# Altium project DAPLink GD32F103RCT6.PrjPcb
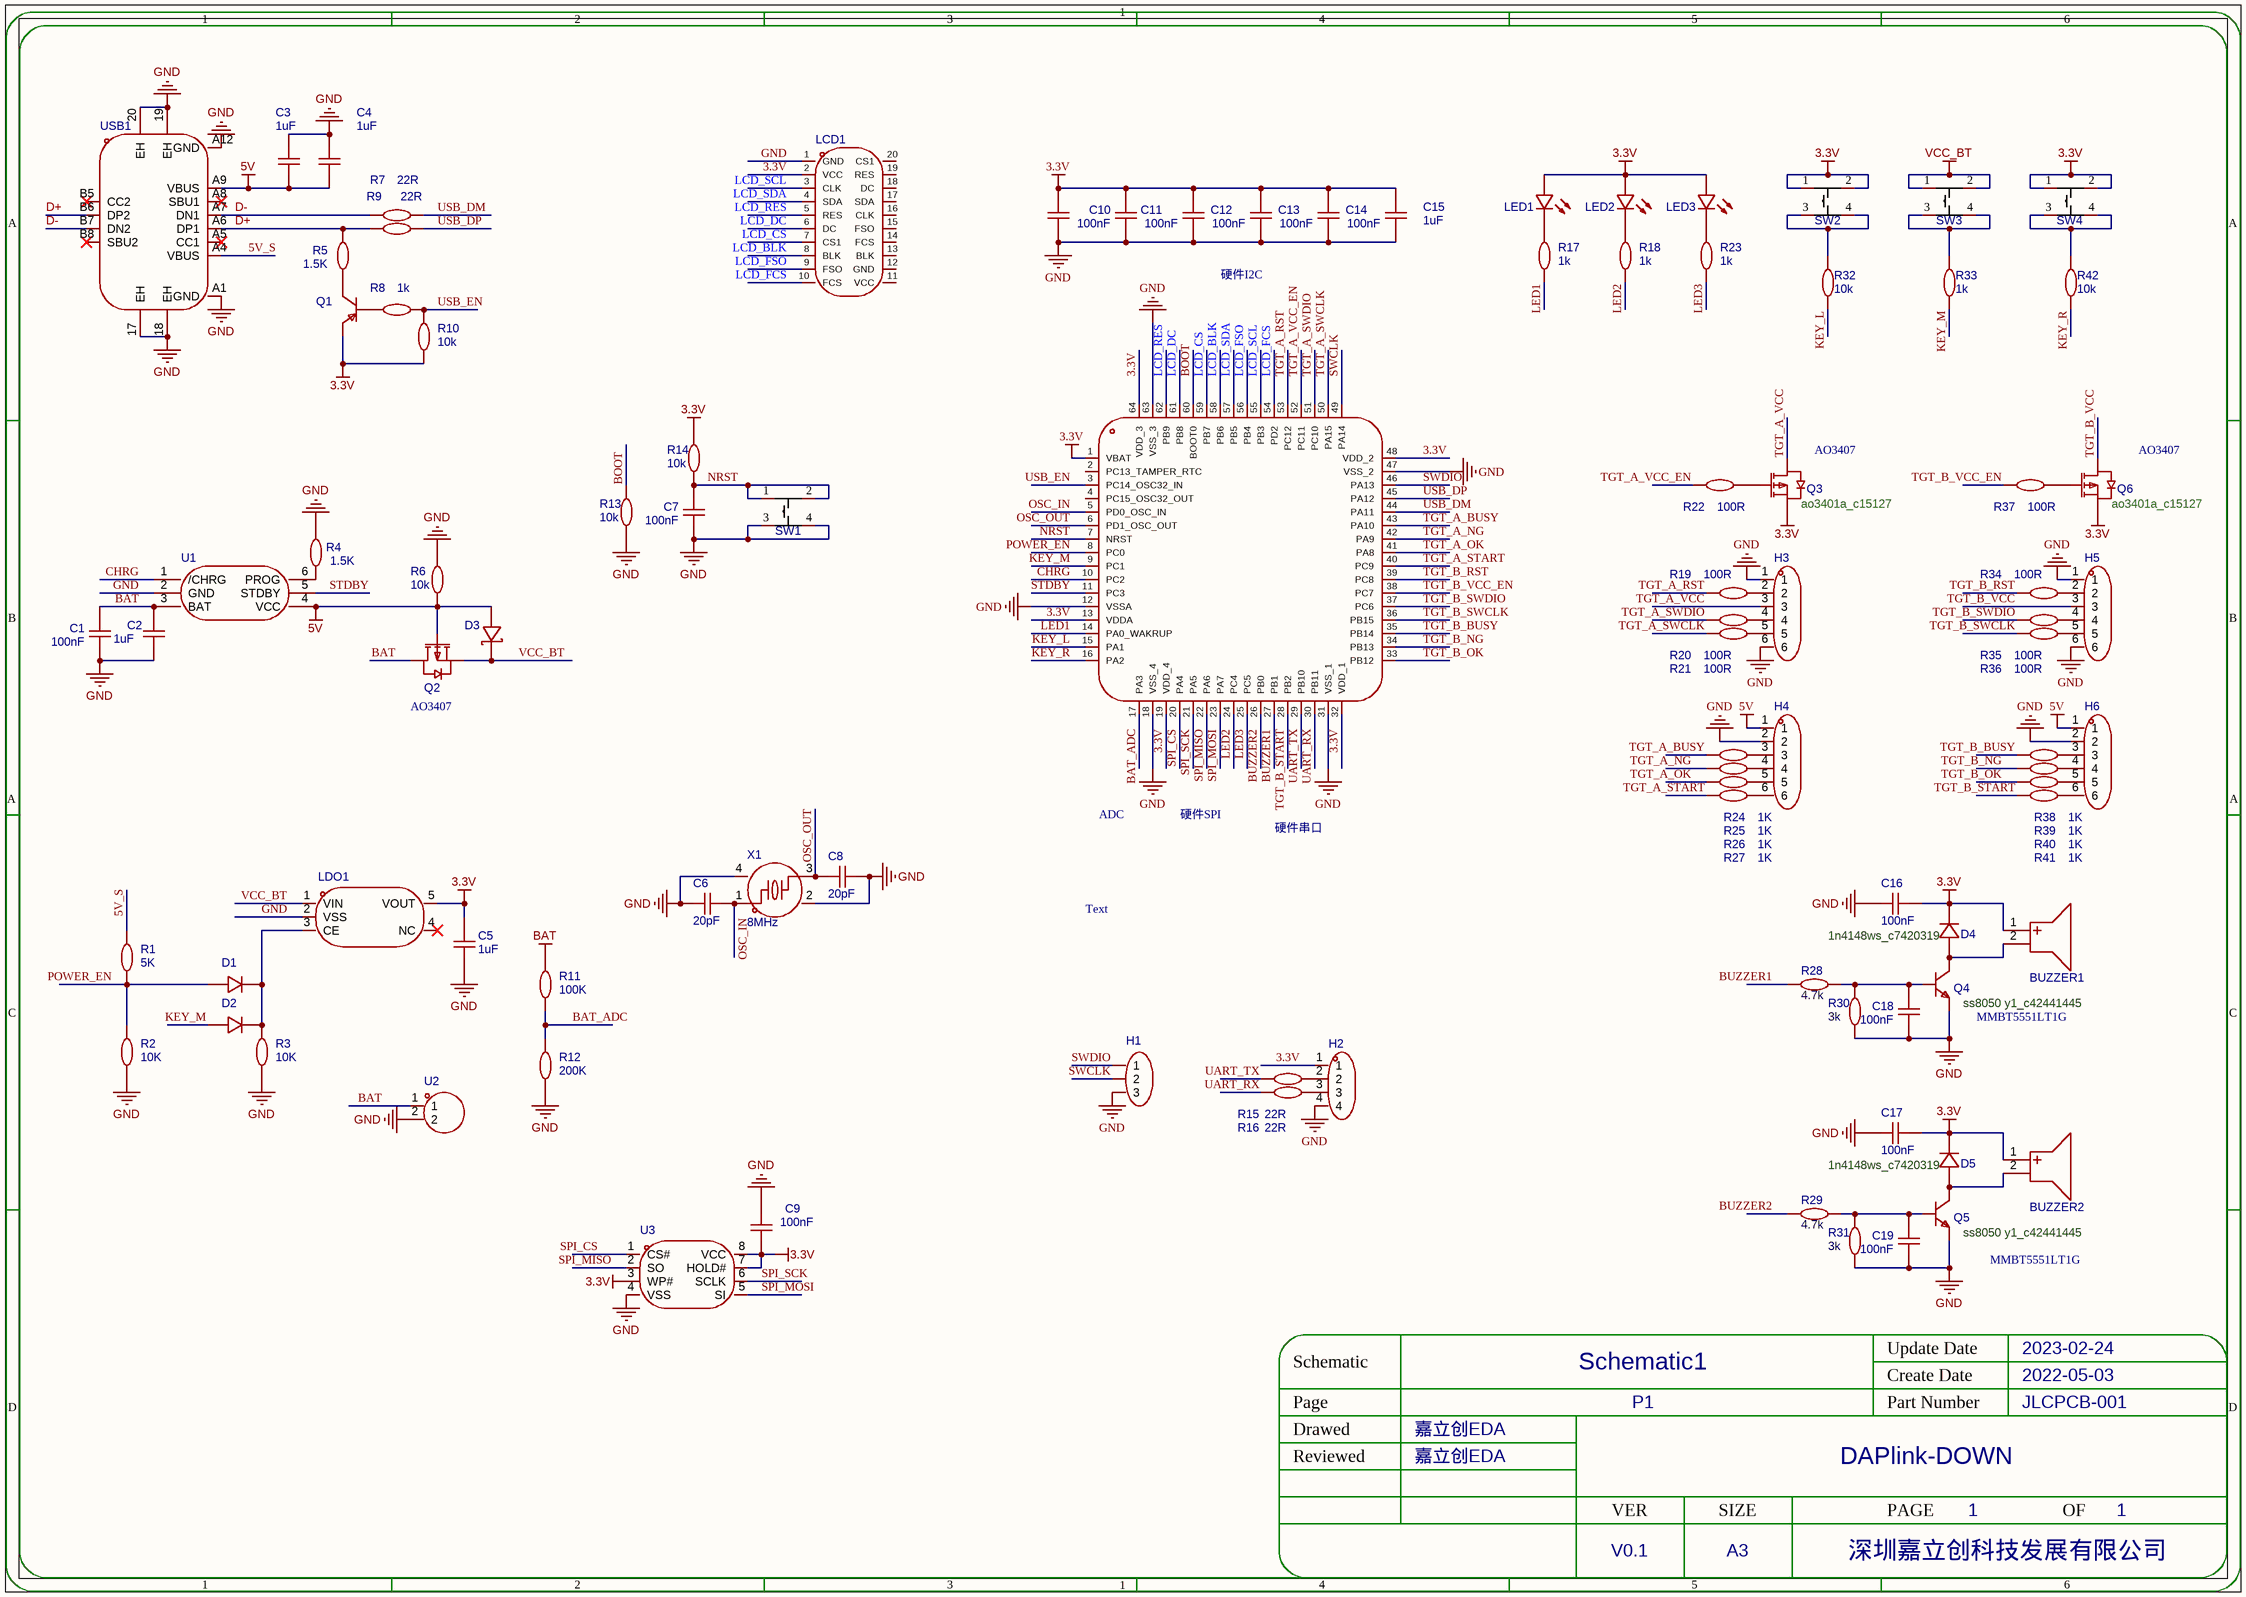
[diagram p0: DAPLink GD32F103RCT6.schdoc]
1 sheet, 95 parts. Net scope: global (net labels, ports and power ports of the same name join across sheets).
Board file: DAPLink GD32F103RCT6.PcbDoc

## Sheet DAPLink GD32F103RCT6.schdoc
size 420 x 298 mm; Symbol: Sheet-Symbol_A3; Company: 深圳嘉立创科技发展有限公司; Drawed: 嘉立创EDA; Reviewed: 嘉立创EDA; Version: V0.1; Page Size: A3; Part Number: JLCPCB-001; @Page No: 1; @Page Name: P1; Convert to PCB: yes; Add into BOM: yes; @Project Name: DAPlink-DOWN; @Page Count: 1; @Update Date: 2023-02-24; @Create Date: 2022-05-03; @Schematic Name: Schematic1; Device: Sheet-Symbol_A3; SheetNumber: 1; SheetTotal: 1

### Parts
BUZZER1  gsd9605yb-3v2800  [BUZ-SMD_GSD9605YB-3V2800]  (value not drawn)
BUZZER2  gsd9605yb-3v2800  [BUZ-SMD_GSD9605YB-3V2800]  (value not drawn)
C1  value 100nF  [C0402]
C2  value 1uF  [C0603]
C3  value 1uF  [C0805]
C4  value 1uF  [C0603]
C5  value 1uF  [C0603]
C6  value 20pF  [C0402]
C7  value 100nF  [C0603]
C8  value 20pF  [C0402]
C9  value 100nF  [C0402]
C10  value 100nF  [C0402]
C11  value 100nF  [C0402]
C12  value 100nF  [C0402]
C13  value 100nF  [C0402]
C14  value 100nF  [C0402]
C15  value 1uF  [C0603]
C16  value 100nF  [C0603]
C17  value 100nF  [C0603]
C18  value 100nF  [C0603]
C19  value 100nF  [C0603]
D1  1N4007WS  [SOD-323_L1.8-W1.3-LS2.5-RD]  (value not drawn)
D2  1N4007WS  [SOD-323_L1.8-W1.3-LS2.5-RD]  (value not drawn)
D3  (no value)  [SOD-123_L2.8-W1.8-LS3.7-RD]
D4  1n4148ws_c7420319  [SOD-323_L1.7-W1.3-LS2.5-FD]
D5  1n4148ws_c7420319  [SOD-323_L1.7-W1.3-LS2.5-FD]
H1  (no value)  [HDR-TH_3P-P2.54-V-M-1]
H2  lail-pz2.54-4p-l  [CONN-TH_LAIL-PZ2.54-4P-L]  (value not drawn)
H3  lail-pz2.54-6p-l  [CONN-TH_LAIL-PZ2.54-6P-L]  (value not drawn)
H4  lail-pz2.54-6p-l  [CONN-TH_LAIL-PZ2.54-6P-L]  (value not drawn)
H5  lail-pz2.54-6p-l  [CONN-TH_LAIL-PZ2.54-6P-L]  (value not drawn)
H6  lail-pz2.54-6p-l  [CONN-TH_LAIL-PZ2.54-6P-L]  (value not drawn)
LCD1  hs20s010b  [LCD-TH_HS20S010B]  (value not drawn)
LDO1  (no value)  [SOT-23-5_L3.0-W1.7-P0.95-LS2.8-BR]
LED1  (no value)  [LED0603-R-RD]
LED2  (no value)  [LED0603-R-RD]
LED3  (no value)  [LED0603-R-RD]
Q1  S8550  [SOT-23-3_L2.9-W1.6-P1.90-LS2.8-BR]  (value not drawn)
Q2  (no value)  [SOT-23-3_L2.9-W1.3-P1.90-LS2.4-BR]
Q3  ao3401a_c15127  [SOT-23_L2.9-W1.3-P1.90-LS2.4-BR]
Q4  ss8050 y1_c42441445  [SOT-23-3_L2.9-W1.5-P2.0-LS2.5-BR]
Q5  ss8050 y1_c42441445  [SOT-23-3_L2.9-W1.5-P2.0-LS2.5-BR]
Q6  ao3401a_c15127  [SOT-23_L2.9-W1.3-P1.90-LS2.4-BR]
R1  value 5K  [R0603]
R2  value 10K  [R0603]
R3  value 10K  [R0603]
R4  value 1.5K  [R0603]
R5  value 1.5K  [R0603]
R6  value 10k  [R0603]
R7  value 22R  [R0402]
R8  value 1k  [R0603]
R9  value 22R  [R0402]
R10  value 10k  [R0603]
R11  value 100K  [R0603]
R12  value 200K  [R0603]
R13  value 10k  [R0603]
R14  value 10k  [R0603]
R15  value 22R  [R0603]
R16  value 22R  [R0603]
R17  value 1k  [R0603]
R18  value 1k  [R0603]
R19  value 100R  [R0603]
R20  value 100R  [R0603]
R21  value 100R  [R0603]
R22  value 100R  [R0603]
R23  value 1k  [R0603]
R24  value 1K  [R0603]
R25  value 1K  [R0603]
R26  value 1K  [R0603]
R27  value 1K  [R0603]
R28  4.7k  [R0603]
R29  4.7k  [R0603]
R30  3k  [R0603]
R31  3k  [R0603]
R32  value 10k  [R0603]
R33  value 1k  [R0603]
R34  value 100R  [R0603]
R35  value 100R  [R0603]
R36  value 100R  [R0603]
R37  value 100R  [R0603]
R38  value 1K  [R0603]
R39  value 1K  [R0603]
R40  value 1K  [R0603]
R41  value 1K  [R0603]
R42  value 10k  [R0603]
SW1  TS-1002S-07526C  [DOT6X6SMT]  (value not drawn)
SW2  TS-1002S-07526C  [DOT6X6SMT]  (value not drawn)
SW3  TS-1002S-07526C  [DOT6X6SMT]  (value not drawn)
SW4  TS-1002S-07526C  [DOT6X6SMT]  (value not drawn)
U1  TP4059  [SOT-23-6_L2.9-W1.6-P0.95-LS2.8-BR]  (value not drawn)
U2  (no value)  [CONN-TH_T2B-SQ-LF-SN]
U3  (no value)  [SOP-8_L5.3-W5.2-P1.27-LS7.9-BL]
U4  gd32f103rct6  [LQFP-64_L10.0-W10.0-P0.50-LS12.0-BL]  (value not drawn)
USB1  (no value)  [USB-C-SMD_TYPE-C-16P-QTGM027]
X1  value 8MHz  [OSC-SMD_4P-L3.2-W2.5-BL]

### Nets
3.3V: BUZZER1.1(+) BUZZER2.1(+) C5.2 C9.1 C10.2 C11.2 C12.2 C13.2 C14.2 C15.2 C16.1 C17.1 D4.2(K) D5.2(K) H2.1 LCD1.2(VCC) LDO1.5(VOUT) LED1.1(A) LED2.1(A) LED3.1(A) Q1.2 Q3.2(S) Q6.2(S) R10.1 R14.2 SW2.1 SW2.2 SW4.1 SW4.2 U3.3(WP#) U3.7(HOLD#) U3.8(VCC) U4.1(VBAT) U4.13(VDDA) U4.19(VDD_4) U4.32(VDD_1) U4.48(VDD_2) U4.64(VDD_3)
5V: C3.1 C4.1 D3.2(A) H4.1 H6.1 Q2.1(G) R6.1 U1.4(VCC) USB1.A9(VBUS)
BAT: C1.2 C2.2 Q2.3(D) R11.2 U1.3(BAT) U2.1
GND: C1.1 C2.1 C3.2 C4.2 C5.1 C6.1 C7.1 C8.2 C9.2 C10.1 C11.1 C12.1 C13.1 C14.1 C15.1 C16.2 C17.2 C18.1 C19.1 H1.3 H2.4 H3.1 H3.6 H4.2 H5.1 H5.6 H6.2 LCD1.1(GND) LDO1.2(VSS) Q4.2(E) Q5.2(E) R2.1 R3.1 R4.1 R6.2 R12.1 R13.1 R30.1 R31.1 SW1.3 SW1.4 U1.2(GND) U2.2 U3.4(VSS) U4.12(VSSA) U4.18(VSS_4) U4.31(VSS_1) U4.47(VSS_2) U4.63(VSS_3) USB1.17(EH) USB1.18(EH) USB1.19(EH) USB1.20(EH) USB1.A1(GND) USB1.A12(GND) X1.2(GND) X1.4(GND)
VCC_BT: D3.1(K) LDO1.1(VIN) Q2.2(S) SW3.1 SW3.2
5V_S: R1.2 USB1.A4(VBUS)
BAT_ADC: R11.1 R12.2 U4.17(PA3)
BOOT: R13.2 U4.60(BOOT0)
BUZZER1: R28.1 U4.27(PB1)
BUZZER2: R29.1 U4.26(PB0)
CHRG: U1.1(/CHRG) U4.10(PC2)
D+: R5.1 R9.2 USB1.A6(DP1) USB1.B6(DP2)
D-: R7.1 USB1.A7(DN1) USB1.B7(DN2)
KEY_L: R32.1 U4.15(PA1)
KEY_M: D2.2(A) R33.1 U4.9(PC1)
KEY_R: R42.1 U4.16(PA2)
LCD_BLK: LCD1.8(BLK) U4.58(PB6)
LCD_CS: LCD1.7(CS1) U4.59(PB7)
LCD_DC: LCD1.6(DC) U4.61(PB8)
LCD_FCS: LCD1.10(FCS) U4.54(PD2)
LCD_FSO: LCD1.9(FSO) U4.56(PB4)
LCD_RES: LCD1.5(RES) U4.62(PB9)
LCD_SCL: LCD1.3(CLK) U4.55(PB3)
LCD_SDA: LCD1.4(SDA) U4.57(PB5)
LED1: R17.1 U4.14(PA0_WAKRUP)
LED2: R18.1 U4.24(PC4)
LED3: R23.1 U4.25(PC5)
NRST: C7.2 R14.1 SW1.1 SW1.2 U4.7(NRST)
OSC_IN: C6.2 U4.5(PD0_OSC_IN) X1.1
OSC_OUT: C8.1 U4.6(PD1_OSC_OUT) X1.3
POWER_EN: D1.2(A) R1.1 R2.2 U4.8(PC0)
SPI_CS: U3.1(CS#) U4.20(PA4)
SPI_MISO: U3.2(SO) U4.22(PA6)
SPI_MOSI: U3.5(SI) U4.23(PA7)
SPI_SCK: U3.6(SCLK) U4.21(PA5)
STDBY: U1.5(STDBY) U4.11(PC3)
SWCLK: H1.2 U4.49(PA14)
SWDIO: H1.1 U4.46(PA13)
TGT_A_BUSY: R24.2 U4.43(PA10)
TGT_A_NG: R25.2 U4.42(PA9)
TGT_A_OK: R26.2 U4.41(PA8)
TGT_A_RST: R19.2 U4.53(PC12)
TGT_A_START: R27.2 U4.40(PC9)
TGT_A_SWCLK: R21.2 U4.50(PA15)
TGT_A_SWDIO: R20.2 U4.51(PC10)
TGT_A_VCC: H3.3 Q3.3(D)
TGT_A_VCC_EN: R22.2 U4.52(PC11)
TGT_B_BUSY: R38.2 U4.35(PB14)
TGT_B_NG: R39.2 U4.34(PB13)
TGT_B_OK: R40.2 U4.33(PB12)
TGT_B_RST: R34.2 U4.39(PC8)
TGT_B_START: R41.2 U4.28(PB2)
TGT_B_SWCLK: R36.2 U4.36(PB15)
TGT_B_SWDIO: R35.2 U4.37(PC6)
TGT_B_VCC: H5.3 Q6.3(D)
TGT_B_VCC_EN: R37.2 U4.38(PC7)
UART_RX: R16.2 U4.30(PB11)
UART_TX: R15.2 U4.29(PB10)
USB_DM: R7.2 U4.44(PA11)
USB_DP: R9.1 U4.45(PA12)
USB_EN: R8.1 R10.2 U4.3(PC14_OSC32_IN)
NetBUZZER1_2: BUZZER1.2(-) D4.1(A) Q4.3(C)
NetBUZZER2_2: BUZZER2.2(-) D5.1(A) Q5.3(C)
NetC18_2: C18.2 Q4.1(B) R28.2 R30.2
NetC19_2: C19.2 Q5.1(B) R29.2 R31.2
NetD1_1: D1.1(K) D2.1(K) LDO1.3(CE) R3.2
NetH2_2: H2.2 R15.1
NetH2_3: H2.3 R16.1
NetH3_2: H3.2 R19.1
NetH3_4: H3.4 R20.1
NetH3_5: H3.5 R21.1
NetH4_3: H4.3 R24.1
NetH4_4: H4.4 R25.1
NetH4_5: H4.5 R26.1
NetH4_6: H4.6 R27.1
NetH5_2: H5.2 R34.1
NetH5_4: H5.4 R35.1
NetH5_5: H5.5 R36.1
NetH6_3: H6.3 R38.1
NetH6_4: H6.4 R39.1
NetH6_5: H6.5 R40.1
NetH6_6: H6.6 R41.1
NetLED1_2: LED1.2(K) R17.2
NetLED2_2: LED2.2(K) R18.2
NetLED3_2: LED3.2(K) R23.2
NetQ1_1: Q1.1 R8.2
NetQ1_3: Q1.3 R5.2
NetQ3_1: Q3.1(G) R22.1
NetQ6_1: Q6.1(G) R37.1
NetR4_2: R4.2 U1.6(PROG)
NetR32_2: R32.2 SW2.3 SW2.4
NetR33_2: R33.2 SW3.3 SW3.4
NetR42_2: R42.2 SW4.3 SW4.4

Not connected (* = marked no-connect by the designer): LCD1 11(VCC) 12(GND) 13(BLK) 14(FCS) 15(FSO) 16(CLK) 17(SDA) 18(DC) 19(RES) 20(CS1); LDO1 4(NC)*; U4 2(PC13_TAMPER_RTC) 4(PC15_OSC32_OUT); USB1 A5(CC1)* A8(SBU1)* B5(CC2)* B8(SBU2)*

### Notes on the sheet
- 硬件I2C
- (near Q3) AO3407
- (near Q6) AO3407
- (near Q2) AO3407
- ADC
- 硬件SPI
- 硬件串口
- Text
- (near Q4) MMBT5551LT1G
- (near Q5) MMBT5551LT1G
- 1
- 2
- 3
- 4
- 5
- 6
- A
- B
- C
- Update Date
- 2023-02-24
- D
- Schematic
- Page
- P1
- Schematic1
- Create Date
- Part Number
- JLCPCB-001
- 2022-05-03
- Reviewed
- Drawed
- 嘉立创EDA
- DAPlink-DOWN
- VER
- V0.1
- SIZE
- A3
- PAGE
- 深圳嘉立创科技发展有限公司
- OF

### Library data of the parts
BUZZER1 BUZZER2 = gsd9605yb-3v2800: 驱动方式:有源(内含驱动线路);构造类型:电磁式;额定电压:3.3V;频率:2.7kHz;声压(SPL):80dB;; Manufacturer: INGHAi(赢海); AddInBom: yes; ModelId: d9f071f9511e4f7795b1f85db8085480; ModelName: BUZ-SMD_L9.6-W9.6-H5.0; ModelTransform: 393.7,377.952,0,270,0,0,0,0,0; Voltage Rating: 3.3V; Voltage - Supply: 2V~5V; Value: 2.7kHz; Current Consumption: 30mA; Sound Pressure Level(SPL): 80dB; Symbol: GSD9605YB-3V2800; LCSC Part Name: 9.6*9.6*5mm电磁有源 3V; SupplierPart: C255327; ManufacturerPart: GSD9605YB-3V2800; Supplier Footprint: SMD,9.6x9.6mm; JLCPCB Part Class: Extended Part; Datasheet: https://item.szlcsc.com/datasheet/GSD9605YB-3V2800/249279.html; Supplier: LCSC; ConvertToPcb: yes; FootprintName: BUZ-SMD_GSD9605YB-3V2800; Driver Circuitry: 有源(内含驱动线路); Technology: 电磁式; Diameter(φD): -; Length: 9.6mm; Width: 9.6mm; Height: 5.2mm; Operating Temperature: -20℃~+70℃; Mounting Type: 贴片; Lead Pitch: -; Continuous Operating Time: -
C1 C7 C9-C14 C16-C19 = CC0402CRNPO9BN100: 容值:10pF;精度:±0.25pF;额定电压:50V;温度系数:NP0;; Manufacturer: YAGEO(国巨); AddInBom: yes; ModelId: 36a51122f27c49738f86b3bfa98863e0; ModelName: C0402_L1.0-W0.5-H0.5; ModelTransform: 39.37,19.685,0,0,0,0,0,0,0; Tolerance: ±0.25pF; Voltage Rated: 50V; Temperature Coefficient: NP0; Device: CC0402CRNPO9BN100; Symbol: CC0402CRNPO9BN100; LCSC Part Name: 10pF ±0.25pF 50V; SupplierPart: C526974; ManufacturerPart: CC0402CRNPO9BN100; Supplier Footprint: 0402; JLCPCB Part Class: Extended Part; Datasheet: https://atta.szlcsc.com/upload/public/pdf/source/20200508/C526974_3517A3A30DC68049E27EE400BC6F4C82.pdf; Supplier: LCSC; ConvertToPcb: yes; FootprintName: C0402
C2 C4 C5 C15 = C0603C102K1RAC3083: 容值:1nF;精度:±10%;额定电压:100V;温度系数:X7R;; Manufacturer: KEMET(基美); AddInBom: yes; ModelId: ac125912035d415993ca9572d50418b1; ModelName: C0603_L1.6-W0.8-H0.8; ModelTransform: 62.992,31.496,0,0,0,0,0,0,0; Tolerance: ±10%; Voltage Rated: 100V; Temperature Coefficient: X7R; Device: C0603C102K1RAC3083; Symbol: C0603C102K1RAC3083; LCSC Part Name: 1nF ±10% 100V; SupplierPart: C561818; ManufacturerPart: C0603C102K1RAC3083; Supplier Footprint: 0603; JLCPCB Part Class: Extended Part; Datasheet: https://atta.szlcsc.com/upload/public/pdf/source/20200618/C599608_2B9CFB7169FD5127D28BF69D59417288.pdf; Supplier: LCSC; ConvertToPcb: yes; FootprintName: C0603
C3 = CS0805KKX7R8BB105: 容值:1uF;精度:±10%;额定电压:25V;温度系数:X7R;; Manufacturer: YAGEO(国巨); AddInBom: yes; ModelId: 1ba041120af144c991958decab20d241; ModelName: C0805_L2.0-W1.3-H1.3; ModelTransform: 78.74,51.181,0,0,0,0,0,0.0005,0; Tolerance: ±10%; Voltage Rated: 25V; Temperature Coefficient: X7R; Device: CS0805KKX7R8BB105; Symbol: CS0805KKX7R8BB105; LCSC Part Name: 1uF ±10% 25V; SupplierPart: C272869; ManufacturerPart: CS0805KKX7R8BB105; Supplier Footprint: 0805; JLCPCB Part Class: Extended Part; Datasheet: https://atta.szlcsc.com/upload/public/pdf/source/20180820/C272869_BA73BCEFB473D3E1AF31EC64F07F73BB.pdf; Supplier: LCSC; ConvertToPcb: yes; FootprintName: C0805
C6 C8 = GCM1555C1H200JA16D: 容值:20pF;精度:±5%;额定电压:-;温度系数:-;; Manufacturer: muRata(村田); AddInBom: yes; ModelId: 36a51122f27c49738f86b3bfa98863e0; ModelName: C0402_L1.0-W0.5-H0.5; ModelTransform: 39.37,19.685,0,0,0,0,0,0,0; Tolerance: ±5%; Device: GCM1555C1H200JA16D; Symbol: GCM1555C1H200JA16D; LCSC Part Name: 20pF(200) ±5% 50V; SupplierPart: C343868; ManufacturerPart: GCM1555C1H200JA16D; Supplier Footprint: 0402; JLCPCB Part Class: Extended Part; Datasheet: https://atta.szlcsc.com/upload/public/pdf/source/20200713/C701256_2542DCDD70722D2BE0CCE4799A0421BC.pdf; Supplier: LCSC; ConvertToPcb: yes; FootprintName: C0402; Voltage Rated: -; Temperature Coefficient: -
D1 D2 = 1N4007WS: 1000V,1A,VF=1.1V@1A，M7小封装; Manufacturer: MDD; AddInBom: yes; ModelId: e9dd044ee7bf4221b3b795eb56bce7c0; ModelName: SOD-323_L1.7-W1.3-H1.1-LS2.5; ModelTransform: 98.91933,51.181,0,180,0,0,0.985,-0.0005,0; Device: 1N4007WS; Symbol: 1N4007WS; LCSC Part Name: 1N4007WS; SupplierPart: C193404; ManufacturerPart: 1N4007WS; Supplier Footprint: SOD-323; JLCPCB Part Class: 扩展库; Datasheet: https://atta.szlcsc.com/upload/public/pdf/source/20180525/C193404_0C623596A90FA1D1FBDCFE625FBC3C97.pdf; Supplier: LCSC; ConvertToPcb: yes; FootprintName: SOD-323_L1.8-W1.3-LS2.5-RD
D3 = DSK24 K24: 直流反向耐压(Vr):40V;平均整流电流(Io):2A;正向压降(Vf):550mV@2A;; Manufacturer: MDD; AddInBom: yes; ModelId: 7884390a25fb4c08947731ebfba7e3f8; ModelTransform: 144.9,63,0,0,0,0,0,0,0; Reverse Voltage (Vr): 40V; Average Rectified Current (Io): 2A; Device: DSK24 K24; Symbol: DSK24 K24; LCSC Part Name: 40V 2A 550mV@2A; SupplierPart: C64890; ManufacturerPart: DSK24 K24; Supplier Footprint: SOD-123FL; JLCPCB Part Class: Extended Part; Datasheet: https://atta.szlcsc.com/upload/public/pdf/source/20190305/C64890_FF2133F90E969198891C9074DED26AB5.pdf; Supplier: LCSC; ConvertToPcb: yes; FootprintName: SOD-123_L2.8-W1.8-LS3.7-RD; ModelName: SOD-123_L2.8-W1.8-LS3.7-RD; Forward Voltage (Vf@If): 550mV@2A
D4 D5 = 1n4148ws_c7420319: 二极管配置:独立式;整流电流:150mA;直流反向耐压(Vr):100V;正向压降(Vf):1.25V@150mA;反向恢复时间(Trr):4ns;; Manufacturer: R+O(宏嘉诚); AddInBom: yes; ModelId: 0f2f330c645944df9245ac3c3fec3456; ModelTransform: 98.425,49.2125,0,180,0,0,0,0,0; Diode Configuration: 独立式; Pd - Power Dissipation: 200mW; Current - Rectified: 150mA; Voltage - DC Reverse(Vr): 100V; Non-Repetitive Peak Forward Surge Current: 2A; Reverse Leakage Current (Ir): 1uA@75V; Reverse Recovery Time (trr): 4ns; Operating Junction Temperature Range: -55℃~+150℃; Symbol: 1N4148WS_C7420319; LCSC Part Name: 100V 150mA; SupplierPart: C7420319; ManufacturerPart: 1N4148WS; Supplier Footprint: SOD-323; JLCPCB Part Class: Extended Part; Datasheet: https://item.szlcsc.com/datasheet/1N4148WS/8397141.html; Supplier: LCSC; ConvertToPcb: yes; FootprintName: SOD-323_L1.7-W1.3-LS2.5-FD; ModelName: SOD-323_L1.7-W1.3-LS2.5-FD; Voltage - Forward(Vf@If): 1.25V@150mA
H1 = 2.54-1*3P针: 间距:2.54mm;总PIN位数:3;排数:1;插针结构:-;行距:-;安装类型:直插;圆针/方针:-;额定电流:-;额定电压:-;配合针长度:-;塑高:-;触头材质:-;触头镀层:-;颜色:黑色;; Manufacturer: BOOMELE(博穆精密); Symbol: Header-Male-2.54_1x3; AddInBom: yes; ModelId: 94a8ffe137b6410295cb18cd3ffd99db; ModelName: HDR-M-2.54_1x3; ModelTransform: 300,100,0,0,0,0,0,0,-118.1; Pitch: 2.54mm; Device: 2.54-1*3P针; LCSC Part Name: 2.54mm; SupplierPart: C49257; ManufacturerPart: 2.54-1*3P针; Supplier Footprint: 插件; JLCPCB Part Class: Extended Part; Datasheet: https://atta.szlcsc.com/upload/public/pdf/source/20151109/1457707570948.pdf; Supplier: LCSC; ConvertToPcb: yes; FootprintName: HDR-TH_3P-P2.54-V-M-1; Number of Pins: 3; Number of Rows: 1; Pin Structure: -; Row Spacing: -; Mounting Type: 直插; Circluar Pins/Square Pins: -; Current Rating (Max): -; Voltage Rating (Max): -; Length of Mating Pin: -; Insulation Height: -; Contact Material: -; Contact Plating: -; Color: 黑色
H2 = lail-pz2.54-4p-l: 插针结构:1x4P;间距:2.54mm;圆针/方针:方针;安装方式:直插;排数:单排;总PIN位数:4P;额定电流:3A;额定电压:250V;配合针长度:6mm;塑高:2.5mm;端接针长度:3mm;触头材质:黄铜;触头镀层:金;工作温度:-25℃~+80℃;颜色:黑色;; Manufacturer: LAILAN(莱联); AddInBom: yes; ModelId: 112b012cb4004446aa5386c9c86d05f0; ModelTransform: 400.039,100,0,0,0,0,0,0,-118.11; Pin Structure: 1x4P; Pitch: 2.54mm; Circluar Pins/Square Pins: 方针; Current Rating: 3A; Voltage Rating (Max): 250V; LCSC Part Name: 1x4P 间距:2.54mm 方针 直插; SupplierPart: C54950602; ManufacturerPart: LAIL-PZ2.54-4P-L; Supplier Footprint: 插件,P=2.54mm; JLCPCB Part Class: Extended Part; Datasheet: https://item.szlcsc.com/datasheet/LAIL-PZ2.54-4P-L/58519955.html; Supplier: LCSC; ConvertToPcb: yes; SymbolName: LAIL-PZ2.54-4P-L; FootprintName: CONN-TH_LAIL-PZ2.54-4P-L; ModelName: CONN-TH_LAIL-PZ2.54-4P-L; Mounting Type: 直插; Number of Rows: 单排; Number of Pins: 4P; Length of Mating Pin: 6mm; Insulation Height: 2.5mm; Length of End Connection Pin: 3mm; Contact Material: 黄铜; Contact Plating: 金; Operating Temperature: -25℃~+80℃; Color: 黑色
H3-H6 = lail-pz2.54-6p-l: 插针结构:1x6P;间距:2.54mm;圆针/方针:方针;安装方式:直插;排数:单排;总PIN位数:6P;额定电流:3A;额定电压:250V;配合针长度:6mm;塑高:2.5mm;端接针长度:3mm;触头材质:黄铜;触头镀层:金;工作温度:-25℃~+80℃;颜色:黑色;; Manufacturer: LAILAN(莱联); AddInBom: yes; ModelId: 78d66b34ad7c4f8faa1ccf54151694d8; ModelTransform: 599.999,98.8187,0,0,0,0,0,0,-118.11; Pin Structure: 1x6P; Pitch: 2.54mm; Circluar Pins/Square Pins: 方针; Current Rating: 3A; Voltage Rating (Max): 250V; LCSC Part Name: 1x6P 间距:2.54mm 方针 直插; SupplierPart: C54950607; ManufacturerPart: LAIL-PZ2.54-6P-L; Supplier Footprint: 插件,P=2.54mm; JLCPCB Part Class: Extended Part; Datasheet: https://item.szlcsc.com/datasheet/LAIL-PZ2.54-6P-L/58519960.html; Supplier: LCSC; ConvertToPcb: yes; SymbolName: LAIL-PZ2.54-6P-L; FootprintName: CONN-TH_LAIL-PZ2.54-6P-L; ModelName: CONN-TH_LAIL-PZ2.54-6P-L; Mounting Type: 直插; Number of Rows: 单排; Number of Pins: 6P; Length of Mating Pin: 6mm; Insulation Height: 2.5mm; Length of End Connection Pin: 3mm; Contact Material: 黄铜; Contact Plating: 金; Operating Temperature: -25℃~+80℃; Color: 黑色
LCD1 = hs20s010b: 核心芯片:ST7789;尺寸(inch):2;像素分辨率:320x240;; Manufacturer: HS(汉昇); AddInBom: yes; ModelId: 0121547e629f428887221e14eec3ec9e; ModelTransform: 1425.194,2488.18384,0,0,0,0,0,0,0; Controller Type: ST7789; Symbol: HS20S010B; LCSC Part Name: 2.0寸240*320(RGB)彩色SPI串口TFT液晶显示屏; SupplierPart: C5329586; ManufacturerPart: HS20S010B; Supplier Footprint: -; JLCPCB Part Class: Extended Part; Datasheet: https://item.szlcsc.com/datasheet/HS20S010B/6087847.html; Supplier: LCSC; ConvertToPcb: yes; FootprintName: LCD-TH_HS20S010B; ModelName: LCD-TH_HS20S010B; Size: 2; Dot Pixels: 320x240; Operating Temperature: -20℃~+70℃
LDO1 = ME6211C33M5G-N: 输出类型:固定;输出极性:正;输出通道数:1;最大输入电压:6V;输出电压:3.3V;压差:260mV@(200mA);输出电流:500mA;电源纹波抑制比(PRSS):70dB@(1kHz),62dB@(10kHz);; Manufacturer: MICRONE(南京微盟); AddInBom: yes; ModelId: 0a2a1b8f50944f73965918ad6e5fe167; ModelName: SOT-23-5_L2.9-W1.6-H1.1-LS2.8-P0.95; ModelTransform: 114.2,109.6,0,180,0,0,-0.9,0.9,0; Output Type: 固定; Output Polarity: 正; Number of Outputs: 1; Maximum Input Voltage: 6V; Output Voltage: 3.3V; Output Current: 500mA; Device: ME6211C33M5G-N; Symbol: ME6211C33M5G-N; LCSC Part Name: Vin=6V Vout=3.3V 500mA 70dB@(1kHz),62dB@(10kHz); SupplierPart: C82942; ManufacturerPart: ME6211C33M5G-N; Supplier Footprint: SOT-23-5; JLCPCB Part Class: Extended Part; Datasheet: https://atta.szlcsc.com/upload/public/pdf/source/20170918/C82942_1505727073070976520.pdf; Supplier: LCSC; ConvertToPcb: yes; FootprintName: SOT-23-5_L3.0-W1.7-P0.95-LS2.8-BR; Dropout Voltage: 260mV@(200mA); Power Supply Rejection Ratio (PRSS): 70dB@(1kHz),62dB@(10kHz)
LED1-LED3 = NCD0603B4: 发光颜色:蓝灯;; Manufacturer: 国星光电; Symbol: FC-F1608BK-470H5; AddInBom: yes; ModelId: eca76de2c48042b48052f5876bb6c831; ModelTransform: 63.7794,31.496,0,0,0,0,0,0,0; Emitted Color: 蓝灯; Device: NCD0603B4; LCSC Part Name: 蓝灯; SupplierPart: C89814; ManufacturerPart: NCD0603B4; Supplier Footprint: 0603; JLCPCB Part Class: Extended Part; Datasheet: https://atta.szlcsc.com/upload/public/pdf/source/20200820/C89814_3D11357C976AB31B19046E836063F91D.pdf; Supplier: LCSC; ConvertToPcb: yes; FootprintName: LED0603-R-RD; ModelName: LED0603-R-RD
Q1 = S8550_C105432: 晶体管类型:PNP;集射极击穿电压(Vceo):25V;集电极电流(Ic):500mA;功率(Pd):300mW;集电极截止电流(Icbo):100nA;集电极-发射极饱和电压(VCE(sat)@Ic,Ib):600mV@500mA,50mA;直流电流增益(hFE@Ic,Vce):120@50mA,1V;特征频率(fT):150MHz;工作温度:+150℃@(Tj);; Manufacturer: CJ(江苏长电/长晶); AddInBom: yes; ModelId: 89cb27a44ab2466697082bb9fd73a7d0; ModelName: SOT-23-3L_L2.9-W1.6-H1.1-LS2.8-P0.95; ModelTransform: 110.236,114.173,0,180,0,0,-0.005,0.0005,0; Transistor Type: PNP; Collector-Emitter Breakdown Voltage (Vceo): 25V; Collector Current (Ic): 500mA; Power Dissipation (Pd): 300mW; Collector Cut-Off Current (Icbo): 100nA; Transition Frequency (fT): 150MHz; Device: S8550_C105432; Symbol: S8550_C105432; LCSC Part Name: PNP 25V 500mA L档120-200; SupplierPart: C105432; ManufacturerPart: S8550; Supplier Footprint: SOT-23-3L; JLCPCB Part Class: 基础库; Datasheet: https://atta.szlcsc.com/upload/public/pdf/source/20170413/1492062713649.pdf; Supplier: LCSC; ConvertToPcb: yes; FootprintName: SOT-23-3_L2.9-W1.6-P1.90-LS2.8-BR; Collector-Emitter Saturation Voltage (VCE(sat)@Ic,Ib): 600mV@500mA,50mA; DC Current Gain (hFE@Ic,Vce): 120@50mA,1V; Operating Temperature: +150℃@(Tj)
Q2 = AO3423: 类型:P沟道;漏源电压(Vdss):20V;连续漏极电流(Id):4.5A;功率(Pd):1.25W;导通电阻(RDS(on)@Vgs,Id):35mΩ@10V,5.1A;阈值电压(Vgs(th)@Id):1.5V@250A;; Manufacturer: VBsemi(台湾微碧); Symbol: AO3423_C692958; AddInBom: yes; ModelId: c62791f0466c4ae2a892c056b845b0ca; ModelName: SOT-23-3P_L2.9-W1.3-H1.0-LS2.4-P0.95; ModelTransform: 98.425,114.173,0,180,0,0,0.0005,-0.0005,0; Type: P沟道; Drain Source Voltage (Vdss): 20V; Continuous Drain Current (Id): 4.5A; Power Dissipation (Pd): 1.25W; Gate Threshold Voltage (Vgs(th)@Id): 1.5V@250A; Device: AO3423; LCSC Part Name: P沟道 20V 4.5A; SupplierPart: C692958; ManufacturerPart: AO3423; Supplier Footprint: SOT-23-3; JLCPCB Part Class: Extended Part; Datasheet: https://atta.szlcsc.com/upload/public/pdf/source/20200629/C692958_8E3397F4108F33A40C5B9FD9962FA608.pdf; Supplier: LCSC; ConvertToPcb: yes; FootprintName: SOT-23-3_L2.9-W1.3-P1.90-LS2.4-BR; Drain Source On Resistance (RDS(on)@Vgs,Id): 35mΩ@10V,5.1A
Q3 Q6 = ao3401a_c15127: 数量:1个P沟道;漏源电压(Vdss):30V;连续漏极电流(Id):4A;导通电阻(RDS(on)):47mΩ@10V；85mΩ@2.5V；60mΩ@4.5V;耗散功率(Pd):-;阈值电压(Vgs(th)):900mV;; Manufacturer: AOS; AddInBom: yes; ModelId: c62791f0466c4ae2a892c056b845b0ca; ModelName: SOT-23-3P_L2.9-W1.3-H1.0-LS2.4-P0.95; ModelTransform: 98.64468,114.173,0,180,0,0,0.001,-0.002,0; Number: 1个P沟道; Drain to Source Voltage: 30V; Current - Continuous Drain(Id): 4A; Gate Threshold Voltage (Vgs(th)): 900mV; Gate Charge(Qg): 14nC@10V; Input Capacitance(Ciss): 645pF; Reverse Transfer Capacitance (Crss@Vds): 55pF; Output Capacitance(Coss): 80pF; Symbol: AO3401A; LCSC Part Name: 1个P沟道 耐压:30V 电流:4A; SupplierPart: C15127; ManufacturerPart: AO3401A; Supplier Footprint: SOT-23; JLCPCB Part Class: Basic Part; Datasheet: https://item.szlcsc.com/datasheet/AO3401A/15801.html; Supplier: LCSC; ConvertToPcb: yes; FootprintName: SOT-23_L2.9-W1.3-P1.90-LS2.4-BR; RDS(on): 47mΩ@10V；85mΩ@2.5V；60mΩ@4.5V; Pd - Power Dissipation: -; Operating Temperature: -; Type: -
Q4 Q5 = ss8050 y1_c42441445: 晶体管类型:NPN;集电极电流(Ic):1.5A;集射极击穿电压(Vceo):25V;耗散功率(Pd):300mW;直流电流增益(hFE):400;; Manufacturer: TDSEMIC(拓电半导体); AddInBom: yes; ModelId: d6da7d402cef4f10869fb4f7686eaa0f; ModelTransform: 102.362,114.173,0,0,0,0,-0.001,0.002,0; type: NPN; Current - Collector(Ic): 1.5A; Collector - Emitter Voltage VCEO: 25V; Pd - Power Dissipation: 300mW; DC Current Gain: 400; Transition frequency(fT): 100MHz; Current - Collector Cutoff: 100nA; Vce Saturation(VCE(sat)): 500mV; Emitter-Base Voltage(Vebo): 5V; Number: 1个NPN; Symbol: SS8050 Y1_C42441445; LCSC Part Name: NPN 电流:1.5A 电压:25V; SupplierPart: C42441445; ManufacturerPart: SS8050 Y1; Supplier Footprint: SOT-23; JLCPCB Part Class: Extended Part; Datasheet: https://item.szlcsc.com/datasheet/SS8050%2520Y1/44491119.html; Supplier: LCSC; ConvertToPcb: yes; FootprintName: SOT-23-3_L2.9-W1.5-P2.0-LS2.5-BR; ModelName: SOT-23-3_L2.9-W1.5-P2.0-LS2.5-BR; Operating Temperature: -; Configuration: -
R1-R27 R32-R42 = RT0402BRD0722KL: 电阻类型:薄膜电阻;阻值:22kΩ;精度:±0.1%;功率:62.5mW;温度系数:±25ppm/;最大工作电压:50V;工作温度范围:-55~+155;; Manufacturer: YAGEO(国巨); Temperature Coefficient: ±25ppm/; AddInBom: yes; ModelId: 671aefced39d4c318694bba8bd8efd39; ModelName: R0402_L1.0-W0.5-H0.5; ModelTransform: 39.37,19.685,0,0,0,0,0,0.0005,0; Tolerance: ±0.1%; Power(Watts): 62.5mW; Overload Voltage (Max): 50V; Device: RT0402BRD0722KL; Operating Temperature Range: -55~+155; Symbol: RT0402BRD0722KL; LCSC Part Name: 22kΩ ±0.1%; ManufacturerPart: RT0402BRD0722KL; Supplier Footprint: 0402; JLCPCB Part Class: Extended Part; Datasheet: https://atta.szlcsc.com/upload/public/pdf/source/20181031/C326601_1F60CD1C11470B123D5B3D7B2D1FCF5A.pdf; Supplier: LCSC; ConvertToPcb: yes; FootprintName: R0402; Type: 薄膜电阻
  R1-R11 R13-R27 R32 R34-R42: SupplierPart: C326601
R28-R31 = 0603waf1001t5e: 电阻类型:厚膜电阻;阻值:1kΩ;精度:±1%;功率:100mW;工作电压:75V;温度系数:±100ppm/℃;; Manufacturer: UNI-ROYAL(厚声); AddInBom: yes; ModelId: fc143cca1e79419f9cd78b61e9279f08; ModelTransform: 31.8897,63.7794,0,90,0,0,0,0,0; Value: 1kΩ; Tolerance: ±1%; Power(Watts): 100mW; Voltage-Supply(Max): 75V; Symbol: 0603WAF1001T5E; LCSC Part Name: 1kΩ ±1% 100mW 厚膜电阻; SupplierPart: C21190; ManufacturerPart: 0603WAF1001T5E; Supplier Footprint: 0603; JLCPCB Part Class: Basic Part; Datasheet: https://item.szlcsc.com/datasheet/0603WAF1001T5E/21904.html; Supplier: LCSC; ConvertToPcb: yes; FootprintName: R0603; ModelName: R0603; Type: 厚膜电阻; Temperature Coefficient: ±100ppm/℃; Operating Temperature: -55℃~+155℃
SW1-SW4 = TS-1002S-07526C: 轻触按键; Designer: U?; Symbol: TS-1002S-07526C; Device: TS-1002S-07526C
U1 = TP4059: 充电电池的类型:-;电池单元组数:-;最大充电电流:-;充满的电池组电压:-;最大供应电压:-;; Manufacturer: TOPPOWER(南京拓微); AddInBom: yes; ModelId: 18da8f6c14a34920b3e136b5c401a119; ModelName: SOT-23-6_L2.9-W1.6-H1.5-LS2.8-P0.95; ModelTransform: 110.7,114.2,0,180,0,0,0,0,0; Device: TP4059; Symbol: TP4059; LCSC Part Name: TP4059; SupplierPart: C80364; ManufacturerPart: TP4059; Supplier Footprint: SOT-23-6; JLCPCB Part Class: Extended Part; Datasheet: https://atta.szlcsc.com/upload/public/pdf/source/20161128/1480296095027.pdf; Supplier: LCSC; ConvertToPcb: yes; FootprintName: SOT-23-6_L2.9-W1.6-P0.95-LS2.8-BR; Battery Chemistry: -; Number of Cells: -; Charge Current - Max: -; Battery Pack Voltage: -; Voltage - Supply (Max): -; Interface: -
U2 = T2B-SQ(LF)(SN): Manufacturer: JST; AddInBom: yes; ModelId: 56efb3bde5a34c4d8b168c6906234046; ModelName: CONN-TH_T2B-SQ(LF)(SN); ModelTransform: 200,94.5,0,0,0,0,0,0,-118.1; Device: T2B-SQ(LF)(SN); Symbol: T2B-SQ(LF)(SN); LCSC Part Name: T2B-SQ(LF)(SN); SupplierPart: C265429; ManufacturerPart: T2B-SQ(LF)(SN); Supplier Footprint: 插件,P=2.54mm; JLCPCB Part Class: Extended Part; Datasheet: https://atta.szlcsc.com/upload/public/pdf/source/20190115/C265429_C14C29889883140BDA304A73A8EC7CF8.pdf; Supplier: LCSC; ConvertToPcb: yes; FootprintName: CONN-TH_T2B-SQ-LF-SN
U3 = GD25Q128ESIG: 存储器类型:-;存储器构架(格式):-;技术:-;存储器容量:-;时钟频率:-;存储器接口类型:-;; Manufacturer: GigaDevice(兆易创新); AddInBom: yes; ModelId: b3bace262c53465a9e6115a2e0c7b3cc; ModelTransform: 205.9,311,0,0,0,0,0,0,0; Device: GD25Q128ESIG; Symbol: GD25Q128ESIG; LCSC Part Name: GD25Q128ESIG; SupplierPart: C2758105; ManufacturerPart: GD25Q128ESIG; Supplier Footprint: SOP-8; JLCPCB Part Class: Extended Part; Datasheet: https://atta.szlcsc.com/upload/public/pdf/source/20210423/C2758105_5B8FF46BBA9FF880A5F3E50B6815040C.pdf; Supplier: LCSC; ConvertToPcb: yes; FootprintName: SOP-8_L5.3-W5.2-P1.27-LS7.9-BL; ModelName: SOP-8_L5.3-W5.2-P1.27-LS7.9-BL; Memory Type: -; Memory Format: -; Technology: -; Memory Size: -; Clock Frequency: -; Byte-Program Time - tBP: -; Page Programming Time - tPP: -; Memory Interface: -; Voltage - Supply: -; Operating Temperature: -
U4 = gd32f103rct6: CPU内核:ARM Cortex-M3;CPU最大主频:108MHz;CPU位数:32 Bit;; Manufacturer: GigaDevice(兆易创新); AddInBom: yes; ModelId: cd9de06618c44fcf82654c43a457f83c; ModelName: LQFP-64_L10.0-W10.0-H1.4-LS12.0-P0.50; ModelTransform: 472.441,472.441,0,0,0,0,0,0.465,0; CPU Maximum Speed: 108MHz; Core Size: 32 Bit; Program Storage Size: 256KB; Program Memory Type: FLASH; RAM Size: 48KB; Number of I/O: 51; ADC (Bit): 12bit; Oscillator Type: 内置+外置; Voltage - Supply: 2.6V~3.6V; Symbol: GD32F103RCT6; LCSC Part Name: Arm® Cortex®-M3 32-bit MCU; SupplierPart: C80687; ManufacturerPart: GD32F103RCT6; Supplier Footprint: LQFP-64(10x10); JLCPCB Part Class: Extended Part; Datasheet: https://item.szlcsc.com/datasheet/GD32F103RCT6/81837.html; Supplier: LCSC; ConvertToPcb: yes; FootprintName: LQFP-64_L10.0-W10.0-P0.50-LS12.0-BL; CPU Core: ARM Cortex-M3; EEPROM: -; DAC (Bit): 12bit; Operating Temperature: -40℃~+85℃; Features: 日历功能；内置通用定时器；外部管脚复位(NRST)
USB1 = TYPE-C 16P QTGM027: 连接器类型:Type-C;标准:-;公母:母座;触点数量:16;端口数量:1;安装方式:卧贴;额定电流 - 电源:3A;工作温度范围:-30~+80;; Manufacturer: SHOU HAN(首韩); AddInBom: yes; ModelId: 23a4a22a604646cabb08998501ada542; ModelTransform: 460.6,303.1,0,0,0,0,0,-50.4,-31.5; Connector Type: Type-C; Gender: 母座; Number of Contacts: 16; Number of Ports: 1; Current Rating - Power (Max): 3A; Operating Temperature Range: -30~+80; Device: TYPE-C 16P QTGM027; Symbol: TYPE-C 16P QTGM027; LCSC Part Name: Type-C 母座 卧贴 不锈钢外壳 2次模顶; SupplierPart: C2681552; ManufacturerPart: TYPE-C 16P QTGM027; Supplier Footprint: SMD; JLCPCB Part Class: Extended Part; Datasheet: https://atta.szlcsc.com/upload/public/pdf/source/20210224/C2681552_6D044BA0C1A7352EAF06092454113915.pdf; Supplier: LCSC; ConvertToPcb: yes; FootprintName: USB-C-SMD_TYPE-C-16P-QTGM027; ModelName: USB-C-SMD_TYPE-C-16P-QTGM027; Standard: -; Mounting Style: 卧贴
X1 = X32258MOB4SI: 晶振类型:贴片无源晶振;频率:8MHz;频率公差:±10ppm;频率稳定度:±30ppm;负载电容:12pF;工作温度:-40~+85;; Manufacturer: YXC扬兴科技; AddInBom: yes; ModelId: ae22b8d143894765bc8100c37cb6356f; ModelName: OSC-SMD_4P-L3.2-W2.5-H1.0; ModelTransform: 125.984,98.425,0,0,0,0,0,0.005,0; Crystal Type: 贴片无源晶振; Frequency Tolerance: ±10ppm; Frequency Stability: ±30ppm; Load Capacitance: 12pF; Operating Temperature: -40~+85; Device: X32258MOB4SI; Symbol: X32258MOB4SI; LCSC Part Name: YSX321SL 8MHz 12pF ±10ppm; SupplierPart: C2682775; ManufacturerPart: X32258MOB4SI; Supplier Footprint: SMD3225-4P; JLCPCB Part Class: Extended Part; Datasheet: https://atta.szlcsc.com/upload/public/pdf/source/20210106/C2682774_0CD4FDA5D9DA3FBEEC23BD607A48E4B0.pdf; Supplier: LCSC; ConvertToPcb: yes; FootprintName: OSC-SMD_4P-L3.2-W2.5-BL